# Altium schematic sheet MiddleSheet.SchDoc
size A
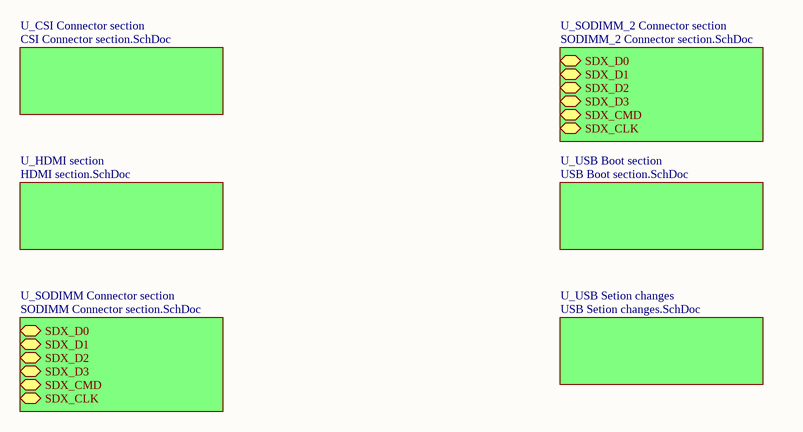
[diagram p0: MiddleSheet.SchDoc]

## Sub-sheets
U_CSI Connector section = CSI Connector section.SchDoc: no entries
U_HDMI section = HDMI section.SchDoc: no entries
U_SODIMM Connector section = SODIMM Connector section.SchDoc: SDX_D0 (bidir), SDX_D1 (bidir), SDX_D2 (bidir), SDX_D3 (bidir), SDX_CMD (bidir), SDX_CLK (bidir)
U_SODIMM_2 Connector section = SODIMM_2 Connector section.SchDoc: SDX_D0 (bidir), SDX_D1 (bidir), SDX_D2 (bidir), SDX_D3 (bidir), SDX_CMD (bidir), SDX_CLK (bidir)
U_USB Boot section = USB Boot section.SchDoc: no entries
U_USB Setion changes = USB Setion changes.SchDoc: no entries